# EasyEDA Pro project EtherCAT-RK3506.epro, board RK3506-V1
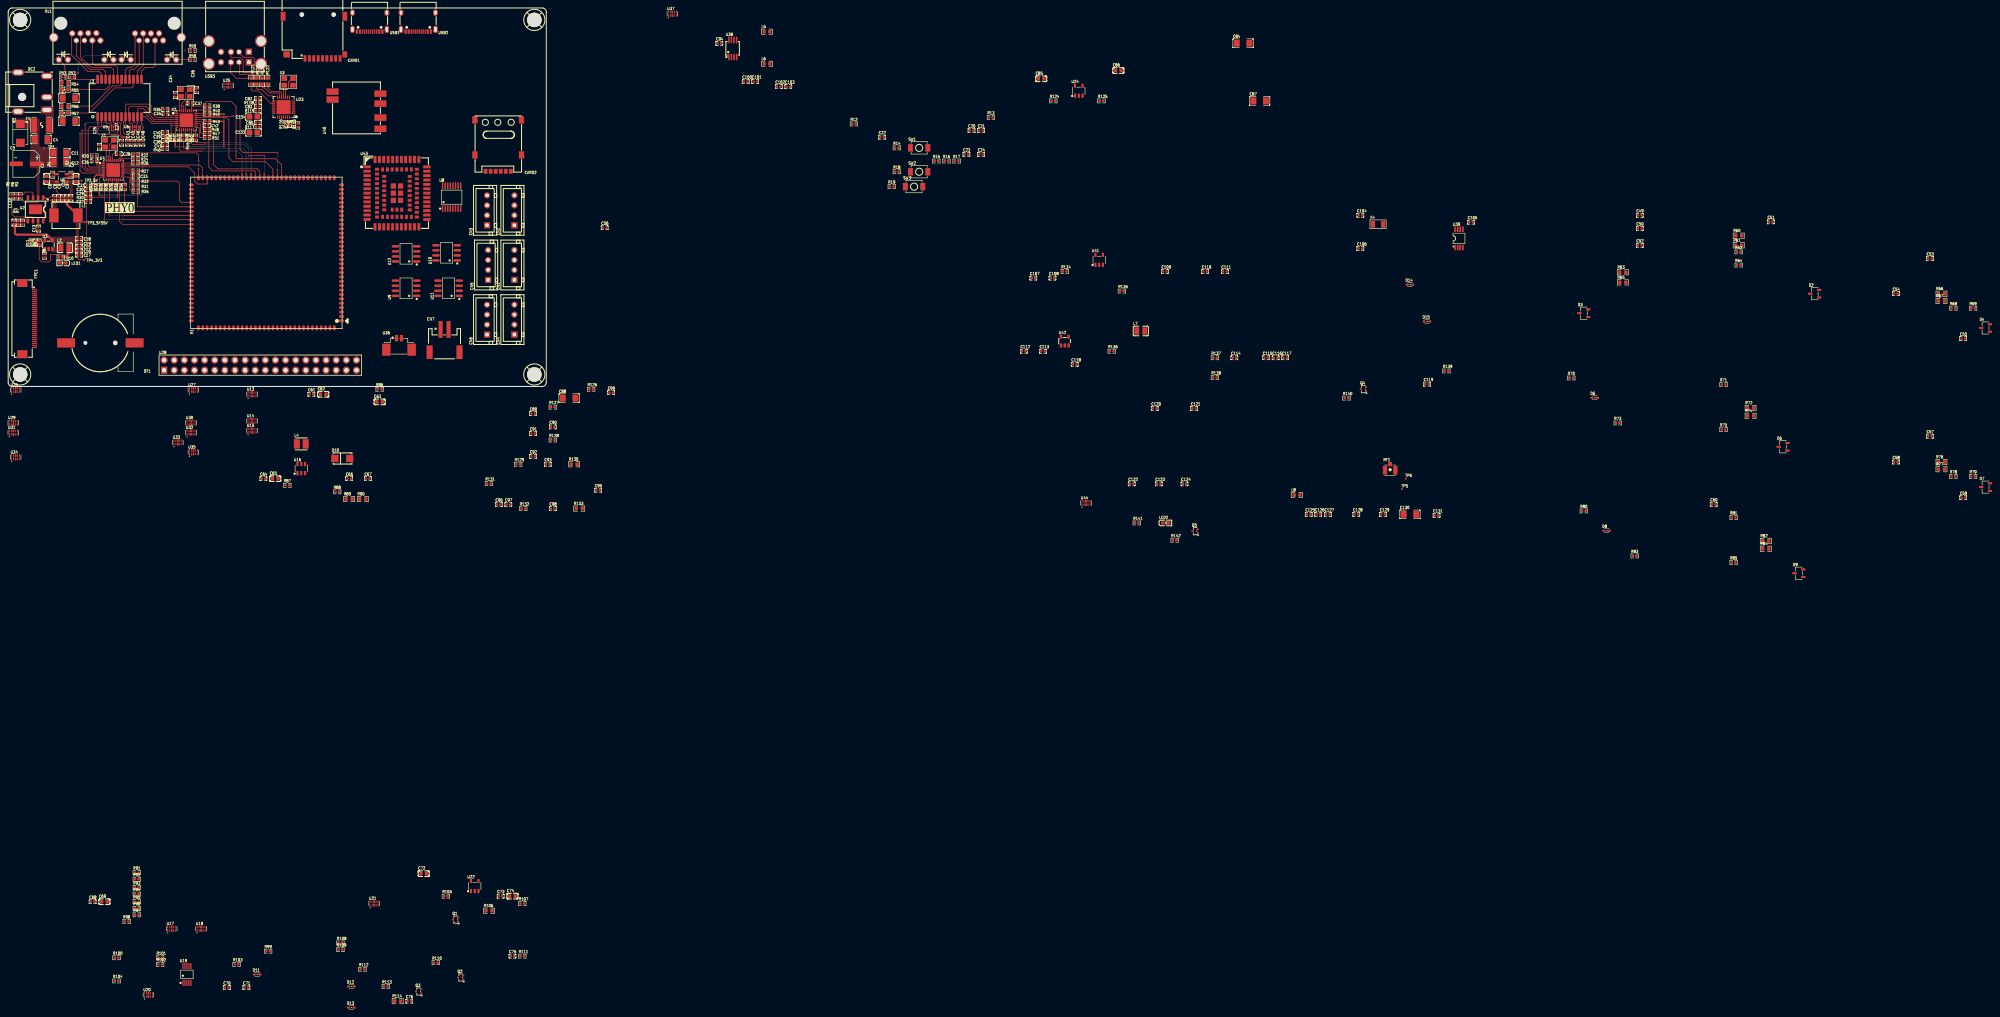
[diagram p12: board, top side]
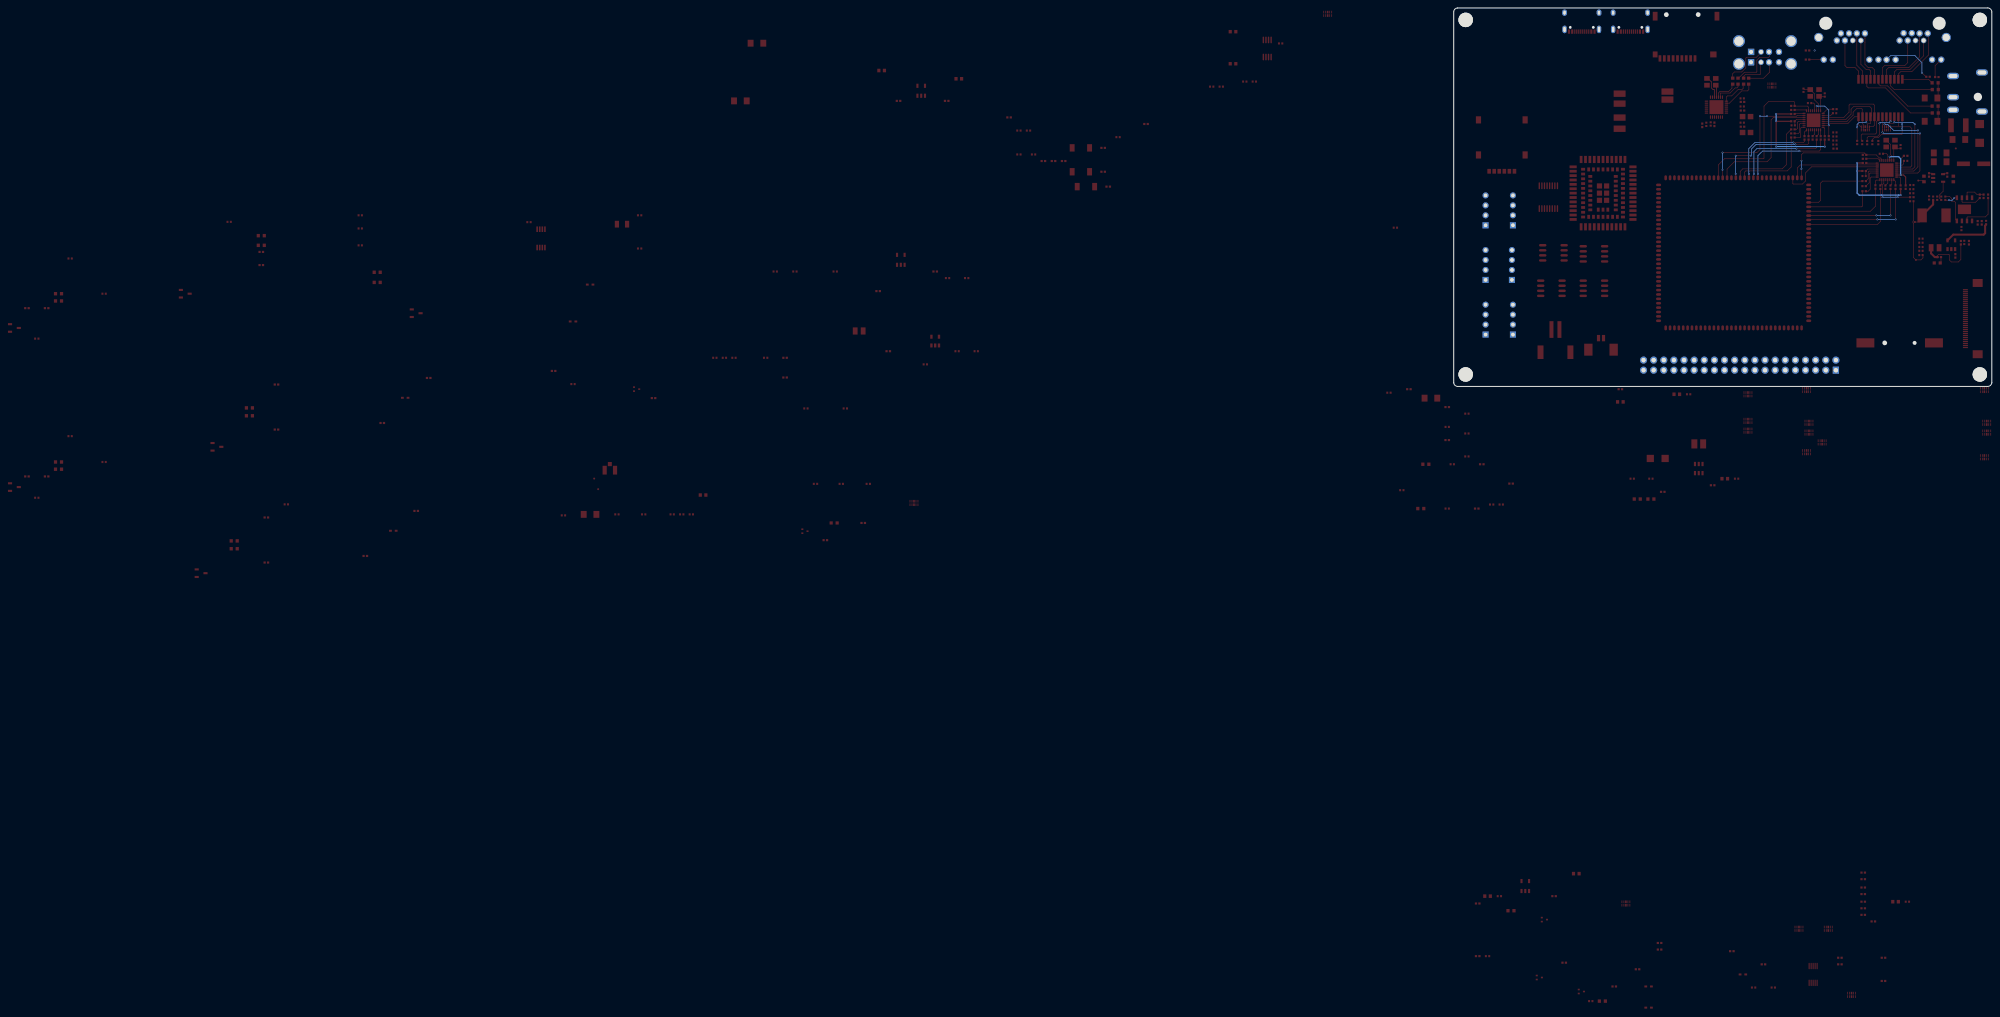
[diagram p13: board, bottom side, seen from below]

Outline 135 x 95 mm; copper layers: Top Layer, Bottom Layer. Coordinates in mm from the lower left corner of the outline.
Outline path: 0,94 0,1 arc(0.29,0.29) 1,0 134,0 arc(134.71,0.29) 135,1 135,94 arc(134.71,94.71) 134,95 1,95 arc(0.29,94.71) 0,94
Stack: Top Layer 0.035mm / Dielectric1 1.51mm FR4 er 4.5 / Bottom Layer 0.035mm

## Design rules (mm)
template: 自定义配置
spacing copperThickness1oz (default): track to track 0.102, other pairs 0.152 to 0.3
spacing copperThickness2oz: track to track 0.203, other pairs 0.152 to 0.3
track width copperThickness1oz (default): min 0.127, default 0.152, max 2.54
track width copperThickness2oz: min 0.203, default 0.254, max 2.54
differential pair differentialPair (default): width min 0.127, default 0.254, max 2.54; gap min 0.152, default 0.152
via viaSize (default): diameter min 0.45, default 0.45, max 10; hole min 0.3, default 0.3, max 6.3

## Placement (name value [footprint] x y rotation side)
BT1  CR1220-A1  [BAT-SMD_CR1220-2]  23.11 10.93 180 top
C1  10uF  [C0603]  9.65 52.07 270 top
C2  22uF  [C0603]  17.02 52.07 270 top
C3  100nF  [C0402]  15.74 47.31 90 top
C4  10uF  [C1206]  8.27 61.98 180 top
C5  100uF  [CAP-SMD_BD6.3-L6.6-W6.6-RD]  4.57 55.88 0 top
C6  100nF  [C0402]  11.67 47.24 90 top
C8  22uF  [C0402]  12.69 47.24 270 top
C9  22uF  [C0402]  13.7 47.24 270 top
C10  100nF  [C0402]  14.72 47.24 270 top
C11  10uF  [C1206]  12.95 58.62 180 top
C12  10uF  [C1206]  12.95 56.39 180 top
C13  1uF  [C0402]  7.62 39.63 90 top
C14  47pF  [C0402]  6.91 36.14 270 top
C15  22uF  [C0402]  17.78 35 180 top
C16  22uF  [C0402]  17.78 34.04 180 top
C17  100nF  [C0402]  17.78 32.97 180 top
C18  22uF  [C0402]  17.78 37.09 180 top
C19  22uF  [C0402]  17.78 36.07 180 top
C20  22uF  [C0402]  241.68 64.22 0 top
C21  22uF  [C0402]  244.08 64.22 0 top
C22  22uF  [C0402]  219.21 62.57 0 top
C23  22uF  [C0402]  240.41 58.23 0 top
C24  22uF  [C0402]  244.08 58.23 0 top
C25  18pF  [C0402]  22.89 60.18 270 top
C26  100nF  [C0402]  21.61 56.62 0 top
C27  18pF  [C0402]  28.47 61.19 270 top
C28  100nF  [C0402]  27.71 58.4 0 top
C29  100nF  [C0402]  20.09 48.49 180 top
C30  100nF  [C0402]  20.09 49.51 180 top
C31  10uF  [C0402]  20.07 50.55 0 top
C32  1uF  [C0402]  20.07 46.49 180 top
C33  100nF  [C0402]  32.03 52.81 0 top
C34  18pF  [C0402]  41.91 73.16 270 top
C35  100nF  [C0402]  39.44 68.58 0 top
C36  18pF  [C0402]  47.24 74.35 270 top
C37  100nF  [C0402]  45.72 71.12 0 top
C38  100nF  [C0402]  39.37 61.73 180 top
C39  100nF  [C0402]  39.37 62.74 180 top
C40  10uF  [C0402]  39.37 63.76 0 top
C41  1uF  [C0402]  39.37 60.71 180 top
C42  100nF  [C0402]  49.83 65.54 0 top
C43  100nF  [C0402]  29.97 61.22 90 top
C44  1nF  [C1206]  15.24 72.39 0 top
C45  100nF  [C0402]  31.27 61.18 90 top
C46  100nF  [C0402]  32.51 61.22 90 top
C47  1nF  [C1206]  15.24 66.55 0 top
C48  100nF  [C0402]  33.78 61.22 90 top
C49  100nF  [C0402]  409.33 42.96 0 top
C50  100nF  [C0402]  409.33 39.66 0 top
C51  100nF  [C0402]  442.22 41.31 0 top
C52  100nF  [C0402]  409.33 35.41 0 top
C53  1uF  [C0402]  482.12 32.11 0 top
C54  1uF  [C0402]  473.6 23.27 0 top
C55  100nF  [C0402]  490.49 11.99 0 top
C56  1uF  [C0402]  149.63 39.84 0 top
C57  1uF  [C0402]  482.12 -12.48 0 top
C58  1uF  [C0402]  473.6 -18.97 0 top
C59  100nF  [C0402]  490.49 -27.95 0 top
C60  1uF  [C0402]  427.88 -29.6 0 top
C61  100nF  [C0402]  76.06 -1.97 0 top
C62  10uF  [C0603]  79.03 -1.97 0 top
C63  10uF  [C0603]  93.19 -3.88 0 top
C64  1uF  [C0402]  64.03 -23.16 0 top
C65  10uF  [C0603]  67 -23.16 0 top
C66  1uF  [C0402]  85.53 -23.16 0 top
C67  1uF  [C0402]  90.22 -23.16 0 top
C68  100nF  [C0402]  21.18 -129.35 0 top
C69  10uF  [C0603]  24.14 -129.35 0 top
C70  4.7uF  [C0402]  54.82 -150.9 0 top
C71  100nF  [C0402]  59.76 -150.9 0 top
C72  22uF  [C0603]  104.24 -122.31 0 top
C73  100nF  [C0402]  123.54 -127.96 0 top
C74  22uF  [C0603]  126.51 -127.96 0 top
C75  100nF  [C0402]  126.51 -143.01 0 top
C76  1uF  [C0402]  100.62 -154.3 0 top
C77  100nF  [C0402]  70.52 65.88 90 top
C79  1uF  [C0402]  71.63 65.79 90 top
C80  100nF  [C0402]  62.62 66.21 0 top
C82  100nF  [C0402]  62.62 72.3 0 top
C83  1uF  [C0402]  62.62 70.27 0 top
C84  10uF  [C1206]  309.81 86.16 0 top
C85  22uF  [C0603]  259.17 77.22 0 top
C86  22uF  [C0603]  278.52 79.3 0 top
C87  10uF  [C1206]  313.97 71.67 0 top
C88  10uF  [C1206]  140.72 -2.95 0 top
C89  1uF  [C0402]  131.69 -6.84 0 top
C90  100pF  [C0402]  136.63 -10.17 0 top
C91  1uF  [C0402]  131.69 -11.82 0 top
C92  4.7nF  [C0402]  131.69 -17.58 0 top
C93  10nF  [C0402]  135.36 -19.54 0 top
C94  1uF  [C0402]  178.42 86.1 0 top
C95  100pF  [C0402]  148.02 -26.04 0 top
C96  22uF  [C0402]  123.08 -29.65 0 top
C97  100nF  [C0402]  125.48 -29.65 0 top
C98  10nF  [C0402]  136.63 -30.66 0 top
C99  4.7nF  [C0402]  151.25 -1.58 0 top
C100  22uF  [C0402]  185.02 76.52 0 top
C101  22uF  [C0402]  187.42 76.52 0 top
C102  680pF  [C0402]  193.32 75.25 0 top
C103  680pF  [C0402]  195.72 75.25 0 top
C104  18pF  [C0402]  339.24 42.96 0 top
C105  1uF  [C0402]  367 41.24 0 top
C106  18pF  [C0402]  339.24 34.62 0 top
C107  22uF  [C0402]  257.19 27.2 0 top
C108  100nF  [C0402]  261.99 27.2 0 top
C109  22uF  [C0402]  290.18 28.85 0 top
C110  100nF  [C0402]  300.28 28.85 0 top
C111  100nF  [C0402]  305.22 28.85 0 top
C112  22uF  [C0402]  254.79 8.84 0 top
C113  100nF  [C0402]  259.59 8.84 0 top
C114  47pF  [C0402]  307.62 7.19 0 top
C115  22uF  [C0402]  315.57 7.19 0 top
C116  22uF  [C0402]  317.97 7.19 0 top
C117  100nF  [C0402]  320.37 7.19 0 top
C118  100nF  [C0402]  267.56 5.54 0 top
C119  100nF  [C0402]  355.96 0.59 0 top
C120  100nF  [C0402]  287.64 -5.53 0 top
C121  100pF  [C0402]  297.52 -5.53 0 top
C122  33pF  [C0402]  281.87 -24.46 0 top
C123  33pF  [C0402]  288.65 -24.46 0 top
C124  33pF  [C0402]  295.12 -24.46 0 top
C125  22uF  [C0402]  326.27 -32.12 0 top
C126  22uF  [C0402]  328.67 -32.12 0 top
C127  22uF  [C0402]  331.07 -32.12 0 top
C128  4.7uF  [C0402]  338.22 -32.12 0 top
C129  100nF  [C0402]  344.94 -32.12 0 top
C130  10uF  [C1206]  351.68 -32.12 0 top
C131  33pF  [C0402]  358.36 -32.37 0 top
C132  1nF  [C0402]  1.44 41.14 270 top
C133  10uF  [C0805]  61.53 63.74 0 top
C134  10uF  [C0805]  61.53 67.73 0 top
CARD1  TF PUSH  [TF-SMD_TF-PUSH]  76.71 87.63 180 top
CARD2  SMN-305  [SIM-SMD_SMN-305]  122.94 60.46 180 top
CN1  LAIL-PHC2.54-4P-01-XH-L  [CONN-TH_LAIL-PHC2.54-4P-01-XH-L]  127 30.48 90 top
CN2  LAIL-PHC2.54-4P-01-XH-L  [CONN-TH_LAIL-PHC2.54-4P-01-XH-L]  127 44.2 90 top
CN3  LAIL-PHC2.54-4P-01-XH-L  [CONN-TH_LAIL-PHC2.54-4P-01-XH-L]  120.14 44.2 90 top
CN4  LAIL-PHC2.54-4P-01-XH-L  [CONN-TH_LAIL-PHC2.54-4P-01-XH-L]  127 16.77 90 top
CN5  LAIL-PHC2.54-4P-01-XH-L  [CONN-TH_LAIL-PHC2.54-4P-01-XH-L]  120.4 30.48 90 top
CN6  LAIL-PHC2.54-4P-01-XH-L  [CONN-TH_LAIL-PHC2.54-4P-01-XH-L]  120.14 16.77 90 top
CN7  HX-PH2.0-2AWB  [CONN-SMD_2P-P2.00_HX-PH2.0-2AWB]  109.47 11.43 0 top
D1  SMBJ33A  [SMB_L4.6-W3.6-LS5.3-RD]  3.05 63.5 270 top
D2  BST23C152V  [SOT-23-3_L3.0-W1.7-P0.95-LS2.9-BR]  453.23 23.27 0 top
D3  BST23C152V  [SOT-23-3_L3.0-W1.7-P0.95-LS2.9-BR]  395.3 18.38 0 top
D4  BST23C152V  [SOT-23-3_L3.0-W1.7-P0.95-LS2.9-BR]  496.1 14.67 0 top
D5  LRB520S-30T1G  [SOD-523_L1.2-W0.8-LS1.6-RD-2]  398.06 -2.86 0 top
D6  BST23C152V  [SOT-23-3_L3.0-W1.7-P0.95-LS2.9-BR]  445.29 -15.16 0 top
D7  BST23C152V  [SOT-23-3_L3.0-W1.7-P0.95-LS2.9-BR]  496.1 -25.27 0 top
D8  LRB520S-30T1G  [SOD-523_L1.2-W0.8-LS1.6-RD-2]  401.04 -36.23 0 top
D9  BST23C152V  [SOT-23-3_L3.0-W1.7-P0.95-LS2.9-BR]  449.26 -46.89 0 top
D10  SM340AF  [SMA-FL_L3.5-W2.5-LS4.6-L-RD]  83.82 -18.08 0 top
D11  LRB520S-30T1G  [SOD-523_L1.2-W0.8-LS1.6-RD-2]  62.45 -147.61 0 top
D12  LRB520S-30T1G  [SOD-523_L1.2-W0.8-LS1.6-RD-2]  86.11 -150.63 0 top
D13  LRB520S-30T1G  [SOD-523_L1.2-W0.8-LS1.6-RD-2]  86.11 -155.94 0 top
D14  LRB520S-30T1G  [SOD-523_L1.2-W0.8-LS1.6-RD-2]  351.66 25.56 0 top
D15  LRB520S-30T1G  [SOD-523_L1.2-W0.8-LS1.6-RD-2]  355.96 16.31 0 top
DC2  DC-044A-A200  [DC-IN-TH_DC-044A-20A]  6.1 73.92 0 top
F1  SMD1812-110-33  [F1812]  8.38 65.54 180 top
FPC1  FPC-05F-30PH20  [FPC-SMD_30P-P0.50_XUNPU_FPC-05F-30PH20]  5.08 17.02 270 top
L1  15uH  [IND-SMD_L7.3-W6.8]  14.48 42.93 0 top
L2  1uH  [L0806]  14.22 34.8 0 top
L3  350uH  [SMD-24_L15.1-W7.1-P1.00-LS10.0-BL]  27.94 72.39 0 top
L4  4.7uH  [IND-SMD_L2.5-W2.5]  73.52 -14.43 0 top
L5  UPZ1608E101-3R0TF  [L0603]  190.37 89.05 0 top
L6  UPZ1608E101-3R0TF  [L0603]  190.37 80.99 0 top
L7  1uH  [L0806]  284.16 13.92 0 top
L8  UPZ1608E101-3R0TF  [L0603]  323.32 -27.26 0 top
LED1  KT-0603R  [LED-SMD_L1.6-W0.8-R-RD]  13.69 30.99 180 top
LED2  KT-0603R  [LED-SMD_L1.6-W0.8-R-RD]  290.43 -34.28 0 top
M1  SOM3506  [SOM3506_128P]  64.77 33.53 90 top
Q1  MMFTN3019E  [SOT-523-3_L1.6-W0.8-P1.00-LS1.6-BR]  112.25 -133.84 0 top
Q2  MMFTN3019E  [SOT-523-3_L1.6-W0.8-P1.00-LS1.6-BR]  113.52 -148.38 0 top
Q3  MMFTN3019E  [SOT-523-3_L1.6-W0.8-P1.00-LS1.6-BR]  102.97 -151.9 0 top
Q4  MMFTN3019E  [SOT-523-3_L1.6-W0.8-P1.00-LS1.6-BR]  340 -0.68 0 top
Q5  MMFTN3019E  [SOT-523-3_L1.6-W0.8-P1.00-LS1.6-BR]  297.77 -36.35 0 top
R1  10kΩ  [R0402]  11.18 53.09 270 top
R2  3.3kΩ  [R0402]  15.75 53.09 90 top
R3  100kΩ  [R0402]  3.02 47.72 270 top
R4  105kΩ  [R0402]  2.53 41.07 270 top
R5  0Ω  [R0402]  0.93 47.72 270 top
R6  47kΩ  [R0402]  2.06 47.72 90 top
R7  20kΩ  [R0402]  3.54 41.07 90 top
R8  10kΩ  [R0402]  9.14 32.77 90 top
R9  45.3kΩ  [R0402]  7.76 36.07 270 top
R10  1kΩ  [R0402]  13.18 32.46 0 top
R11  10kΩ  [R0402]  5.73 36.07 90 top
R12  0Ω  [R0402]  212.19 65.88 0 top
R13  0Ω  [R0402]  246.55 67.53 0 top
R14  100Ω  [R0402]  222.95 59.88 0 top
R15  2.2kΩ  [R0402]  232.86 56.58 0 top
R16  2.2kΩ  [R0402]  235.4 56.58 0 top
R17  10kΩ  [R0402]  237.94 56.58 0 top
R18  100Ω  [R0402]  222.95 53.89 0 top
R19  100Ω  [R0402]  221.68 50.15 0 top
R20  2.49kΩ  [R0402]  21.61 57.89 0 top
R21  0Ω  [R0402]  21.61 50.02 270 top
R22  4.7kΩ  [R0402]  31.93 58.12 0 top
R23  4.7kΩ  [R0402]  22.89 50.02 90 top
R24  4.7kΩ  [R0402]  31.92 57.14 0 top
R25  22Ω  [R0402]  24.16 50.02 270 top
R26  4.7kΩ  [R0402]  31.93 56.09 0 top
R27  100kΩ  [R0402]  32.03 54.08 0 top
R28  22Ω  [R0402]  25.42 50.02 270 top
R29  4.7kΩ  [R0402]  26.69 50.02 90 top
R30  0Ω  [R0402]  20.07 47.5 180 top
R31  4.7kΩ  [R0402]  32.03 50.27 0 top
R32  22Ω  [R0402]  32.03 51.54 0 top
R33  22Ω  [R0402]  27.97 50.02 270 top
R34  22Ω  [R0402]  29.2 50.06 270 top
R35  22Ω  [R0402]  32.03 49 0 top
R36  2.49kΩ  [R0402]  39.37 69.6 0 top
R37  0Ω  [R0402]  40.89 62.39 270 top
R38  4.7kΩ  [R0402]  49.9 70.42 0 top
R39  4.7kΩ  [R0402]  41.91 62.39 90 top
R40  4.7kΩ  [R0402]  49.9 69.4 0 top
R41  22Ω  [R0402]  42.92 62.39 270 top
R42  4.7kΩ  [R0402]  49.9 68.39 0 top
R43  100kΩ  [R0402]  49.9 66.55 0 top
R44  22Ω  [R0402]  43.94 62.39 270 top
R45  4.7kΩ  [R0402]  44.96 62.39 90 top
R46  0Ω  [R0402]  39.3 59.69 180 top
R47  4.7kΩ  [R0402]  49.9 63.5 0 top
R48  22Ω  [R0402]  49.9 64.52 0 top
R49  22Ω  [R0402]  45.97 62.39 270 top
R50  22Ω  [R0402]  46.99 62.39 270 top
R51  22Ω  [R0402]  49.9 62.49 0 top
R52  1kΩ  [R0402]  16 77.73 0 top
R53  1kΩ  [R0402]  13.79 77.65 0 top
R54  75Ω  [R0603]  14.22 76.2 180 top
R55  75Ω  [R0603]  14.19 74.51 180 top
R56  75Ω  [R0603]  14.22 70.36 180 top
R57  75Ω  [R0603]  14.19 68.64 180 top
R58  1kΩ  [R0402]  46.23 82.05 180 top
R59  1kΩ  [R0402]  46.23 84.33 0 top
R60  5.1Ω  [R0603]  434.16 37.84 0 top
R61  5.1Ω  [R0603]  434.16 35.41 0 top
R62  22Ω  [R0402]  434.16 33.76 0 top
R63  5.1Ω  [R0603]  405.08 28.65 0 top
R64  22Ω  [R0402]  434.16 30.46 0 top
R65  5.1Ω  [R0603]  405.08 26.11 0 top
R66  5.1Ω  [R0603]  485.03 23.27 0 top
R67  5.1Ω  [R0603]  485.03 21.46 0 top
R68  60.4Ω  [R0402]  488.01 19.65 0 top
R69  60.4Ω  [R0402]  492.96 19.65 0 top
R70  4.7kΩ  [R0402]  392.16 2.12 0 top
R71  1.5kΩ  [R0402]  430.35 0.47 0 top
R72  5.1Ω  [R0603]  437.14 -5.4 0 top
R73  22Ω  [R0402]  403.81 -9.18 0 top
R74  5.1Ω  [R0603]  437.14 -7.37 0 top
R75  1.5kΩ  [R0402]  430.35 -10.83 0 top
R76  5.1Ω  [R0603]  485.03 -18.97 0 top
R77  5.1Ω  [R0603]  485.03 -20.78 0 top
R78  60.4Ω  [R0402]  488.01 -22.59 0 top
R79  60.4Ω  [R0402]  492.96 -22.59 0 top
R80  4.7kΩ  [R0402]  395.3 -31.25 0 top
R81  1.5kΩ  [R0402]  432.89 -32.9 0 top
R82  5.1Ω  [R0603]  440.95 -38.77 0 top
R83  22Ω  [R0402]  408.06 -42.56 0 top
R84  5.1Ω  [R0603]  440.95 -40.75 0 top
R85  1.5kΩ  [R0402]  432.89 -44.21 0 top
R86  10kΩ  [R0402]  93.19 -0.7 0 top
R87  10kΩ  [R0402]  70.03 -24.81 0 top
R88  100kΩ  [R0402]  82.55 -26.46 0 top
R89  10Ω  [R0603]  85.53 -28.28 0 top
R90  10Ω  [R0603]  88.95 -28.28 0 top
R91  22Ω  [R0402]  32.26 -122.04 0 top
R92  22Ω  [R0402]  32.26 -123.69 0 top
R93  22Ω  [R0402]  32.26 -125.79 0 top
R94  22Ω  [R0402]  32.26 -127.44 0 top
R95  22Ω  [R0402]  32.26 -129.35 0 top
R96  22Ω  [R0402]  32.26 -131 0 top
R97  22Ω  [R0402]  32.26 -132.65 0 top
R98  4.7kΩ  [R0402]  29.72 -134.3 0 top
R99  4.7kΩ  [R0402]  65.22 -141.77 0 top
R100  5.1kΩ  [R0402]  27.18 -143.42 0 top
R101  22Ω  [R0402]  38.11 -143.42 0 top
R102  22Ω  [R0402]  38.11 -145.07 0 top
R103  100Ω  [R0402]  57.29 -145.07 0 top
R104  5.1kΩ  [R0402]  27.18 -149.24 0 top
R105  100kΩ  [R0402]  109.82 -127.96 0 top
R106  6.8kΩ  [R0603]  120.63 -131.61 0 top
R107  10kΩ  [R0402]  128.98 -129.8 0 top
R108  22Ω  [R0402]  83.35 -139.71 0 top
R109  22Ω  [R0402]  83.35 -141.36 0 top
R110  100kΩ  [R0402]  107.28 -144.66 0 top
R111  15kΩ  [R0402]  128.98 -143.01 0 top
R112  15kΩ  [R0402]  88.88 -146.31 0 top
R113  33kΩ  [R0402]  94.72 -150.63 0 top
R114  220kΩ  [R0603]  97.71 -154.3 0 top
R115  0Ω  [R0402]  72.64 65.54 270 top
R116  10kΩ  [R0402]  69.6 65.79 90 top
R117  100kΩ  [R0402]  62.55 65.19 180 top
R118  10kΩ  [R0402]  62.55 71.42 0 top
R119  0Ω  [R0402]  62.55 69.26 0 top
R120  2.2Ω  [R0603]  62.27 76.63 90 top
R121  2.2Ω  [R0603]  61 76.63 90 top
R122  2.2Ω  [R0603]  65 76.63 90 top
R123  2.2Ω  [R0603]  63.68 76.63 90 top
R124  100kΩ  [R0402]  262.2 71.67 0 top
R125  3.3kΩ  [R0402]  274.29 71.67 0 top
R126  2.2kΩ  [R0402]  146.24 -0.7 0 top
R127  1.1kΩ  [R0402]  136.63 -5.19 0 top
R128  1.1kΩ  [R0402]  136.63 -13.47 0 top
R129  1kΩ  [R0402]  127.95 -19.54 0 top
R130  75kΩ  [R0603]  141.99 -19.54 0 top
R131  0Ω  [R0402]  120.61 -24.39 0 top
R132  1kΩ  [R0402]  129.22 -30.66 0 top
R133  75kΩ  [R0603]  143.26 -30.66 0 top
R134  10kΩ  [R0402]  265.09 28.85 0 top
R135  3.3kΩ  [R0402]  279.4 23.93 0 top
R136  10kΩ  [R0402]  276.86 8.84 0 top
R137  53.6kΩ  [R0402]  302.75 7.19 0 top
R138  10kΩ  [R0402]  302.75 2.24 0 top
R139  4.7kΩ  [R0402]  360.83 3.89 0 top
R140  10kΩ  [R0402]  335.75 -2.93 0 top
R141  1kΩ  [R0402]  283.14 -34.28 0 top
R142  10kΩ  [R0402]  292.65 -38.59 0 top
RF1  6GHz  [IPEX-SMD_3P-L2.6-W2.6-LS3.0_RF1200001R]  346.71 -20.26 0 top
RJ1  DS1129-04-S8B0P-X  [RJ45-TH_DS1129-04]  27.43 85.35 180 top
SCREW1  -  [M3螺丝]  3 92 0 top
SCREW2  -  [M3螺丝]  132 92 0 top
SCREW3  -  [M3螺丝]  132 3 0 top
SCREW4  -  [M3螺丝]  3 3 0 top
SW1  TS-1088-AR02016  [SW-SMD_L3.9-W3.0-P4.45]  228.54 59.88 0 top
SW2  TS-1088-AR02016  [SW-SMD_L3.9-W3.0-P4.45]  228.54 53.89 0 top
SW3  TS-1088-AR02016  [SW-SMD_L3.9-W3.0-P4.45]  227.27 50.15 0 top
TP1  -  [Test-Point-0.5mm]  9.03 59.74 0 top
TP2_5V  -  [Test-Point-0.5mm]  18.45 51.68 0 top
TP3_SYS5V  -  [Test-Point-0.5mm]  19.3 41.27 0 top
TP4_3V3  -  [Test-Point-0.5mm]  19.05 31.75 0 top
TP5  -  [Test-Point-0.5mm]  349.65 -25.79 0 top
TP6  -  [Test-Point-0.5mm]  350.65 -23.14 0 top
U1  ETA6280S2F  [SOT-23-5_L3.0-W1.5-P0.95-LS2.8-BL]  13.46 52.33 90 top
U2  ETA2808E8A  [ESOP-8_L4.9-W3.9-P1.27-LS6.0-BL-EP]  6.86 44.45 180 top
U3  ETA3417S2F  [SOT-23-5_L2.9-W1.6-P0.95-LS2.8-BL]  10.16 35.56 0 top
U4  YT8512C  [QFN-32_L5.0-W5.0-P0.50-BL-EP3.4]  26.34 54.31 270 top
U5  LM-SE05NRE14GA  [DFN2510-10_L2.5-W1.0-P0.50-BL]  26.42 64.77 0 top
U6  LM-SE05NRE14GA  [DFN2510-10_L2.5-W1.0-P0.50-BL]  31.75 64.77 0 top
U7  YT8512C  [QFN-32_L5.0-W5.0-P0.50-BL-EP3.4]  44.7 66.81 270 top
U8  BL13232ETS  [TSSOP-16_L5.0-W4.4-P0.65-LS6.4-BL]  111.25 47.5 0 top
U9  SIT1051AT/3  [SOP-8_L4.9-W3.9-P1.27-LS6.0-BL]  99.82 24.64 90 top
U10  HD588E  [SOP-8_L4.9-W3.9-P1.27-LS6.0-BL]  109.98 33.53 90 top
U11  SIT1051AT/3  [SOP-8_L4.9-W3.9-P1.27-LS6.0-BL]  110.49 24.64 90 top
U12  HD588E  [SOP-8_L4.9-W3.9-P1.27-LS6.0-BL]  99.82 33.28 90 top
U13  LM-SE05NRE14GA  [DFN2510-10_L2.5-W1.0-P0.50-BL]  61.18 -1.97 0 top
U14  LM-SE05NRE14GA  [DFN2510-10_L2.5-W1.0-P0.50-BL]  61.18 -8.65 0 top
U15  LM-SE05NRE14GA  [DFN2510-10_L2.5-W1.0-P0.50-BL]  61.18 -11.11 0 top
U16  STI9287C  [SOT-23-6_L2.9-W1.6-P0.95-LS2.8-BL]  73.52 -20.62 0 top
U17  LM-SE05NRE14GA  [DFN2510-10_L2.5-W1.0-P0.50-BL]  41.03 -136.14 0 top
U18  LM-SE05NRE14GA  [DFN2510-10_L2.5-W1.0-P0.50-BL]  48.38 -136.14 0 top
U19  CH340E  [MSOP-10_L3.0-W3.0-P0.50-LS5.0-BL]  44.83 -147.61 0 top
U20  LM-SE05NRE14GA  [DFN2510-10_L2.5-W1.0-P0.50-BL]  35.19 -152.74 0 top
U21  LM-SE05NRE14GA  [DFN2510-10_L2.5-W1.0-P0.50-BL]  91.8 -129.8 0 top
U22  ETA6280S2F  [SOT-23-5_L3.0-W1.5-P0.95-LS2.8-BL]  117.04 -125.42 0 top
U23  CH334H  [QFN-28_L5.0-W5.0-P0.50-BL-EP]  69.09 70.11 90 top
U24  ETA6280S2F  [SOT-23-5_L3.0-W1.5-P0.95-LS2.8-BL]  268.6 74.21 0 top
U25  LM-SE05NRE14GA  [DFN2510-10_L2.5-W1.0-P0.50-BL]  55.17 75.52 0 top
U26  LM-SE05NRE14GA  [DFN2510-10_L2.5-W1.0-P0.50-BL]  1.87 -0.9 0 top
U27  LM-SE05NRE14GA  [DFN2510-10_L2.5-W1.0-P0.50-BL]  46.47 -0.9 0 top
U28  PZ2.54-2*20  [HDR-TH_40P-P2.54-V-M-R2-C20-S2.54]  63.25 5.34 0 top
U29  LM-SE05NRE14GA  [DFN2510-10_L2.5-W1.0-P0.50-BL]  1.28 -9.14 0 top
U30  LM-SE05NRE14GA  [DFN2510-10_L2.5-W1.0-P0.50-BL]  45.87 -9.14 0 top
U31  LM-SE05NRE14GA  [DFN2510-10_L2.5-W1.0-P0.50-BL]  1.28 -11.59 0 top
U32  LM-SE05NRE14GA  [DFN2510-10_L2.5-W1.0-P0.50-BL]  45.87 -11.59 0 top
U33  LM-SE05NRE14GA  [DFN2510-10_L2.5-W1.0-P0.50-BL]  42.57 -14.05 0 top
U34  LM-SE05NRE14GA  [DFN2510-10_L2.5-W1.0-P0.50-BL]  1.87 -17.78 0 top
U35  LM-SE05NRE14GA  [DFN2510-10_L2.5-W1.0-P0.50-BL]  46.47 -16.51 0 top
U36  ZX-MX1.25-2PLT  [CONN-SMD_2P-P1.25-MX1.25-2P-LT]  98.04 10.67 0 top
U37  LM-SE05NRE14GA  [DFN2510-10_L2.5-W1.0-P0.50-BL]  166.62 93.53 0 top
U38  NS4150B  [MSOP-8_L3.0-W3.0-P0.65-LS5.0-BL]  181.78 84.83 0 top
U39  HT8563ARMZ  [MSOP-8_L3.0-W3.0-P0.65-LS4.9-BL]  363.98 37.16 0 top
U40  2.4GHz  [WIRELM-SMD_M573H-USBDG-NN]  87.38 69.35 90 top
U41  ETA6280S2F  [SOT-23-5_L3.0-W1.5-P0.95-LS2.8-BL]  273.72 31.77 0 top
U42  ETA3417S2F  [SOT-23-5_L2.9-W1.6-P0.95-LS2.8-BL]  265.09 11.38 0 top
U43  ML307R-DL  [LCC-LGA-109_L17.7-W15.8-P1.10_MC661]  97.54 48.52 0 top
U44  LM-SE05NRE14GA  [DFN2510-10_L2.5-W1.0-P0.50-BL]  270.41 -29.26 0 top
USB1  TYPE-C 16PIN 2MD(073)  [USB-C-SMD_TYPE-C-16PIN-2MD-073]  90.68 91.44 180 top
USB2  TYPE-C 16PIN 2MD(073)  [USB-C-SMD_TYPE-C-16PIN-2MD-073]  102.87 91.44 180 top
USB3  AF SS-JB17.6  [USB-A-TH_AF-SS-JB17.6]  56.9 83.82 180 top
X1  25MHz  [CRYSTAL-SMD_4P-L3.2-W2.5-BL]  25.4 60.96 180 top
X2  25MHz  [CRYSTAL-SMD_4P-L3.2-W2.5-BL]  44.45 73.66 180 top
X3  12MHz  [CRYSTAL-SMD_4P-L3.2-W2.5-BL]  70.36 76.46 0 top
X4  32.768kHz  [CRYSTAL-SMD_L3.2-W1.5-1]  343.67 40.73 0 top

## Footprints (pads in the part's own frame, mm; a bottom-side part is the same pattern mirrored in y, then rotated)
BAT-SMD_CR1220-2
  rect 4.5x2.3 smd: 1(-8.6,0) 2(8.6,0)
C0402
  rect 0.5x0.54 smd: 1(-0.42,0) 2(0.42,0)
C0603
  rect 0.8x0.9 smd: 1(-0.7,0) 2(0.7,0)
C0805
  rect 1.41x1.35 smd: 1(-1,0) 2(1,0)
C1206
  rect 1.485x1.728 smd: 1(-1.593,0) 2(1.593,0)
CAP-SMD_BD6.3-L6.6-W6.6-RD
  rect 3.26x1.15 smd: 1(2.555,0) 2(-2.555,0)
CONN-SMD_2P-P1.25-MX1.25-2P-LT
  rect 0.8x1.6 smd: 1(-0.625,1.45) 2(0.625,1.45)
  rect 2.1x3 smd: 3(-3.175,-1.45) 4(3.175,-1.45)
CONN-SMD_2P-P2.00_HX-PH2.0-2AWB
  rect 1x4.2 smd: 1(-1,2.85) 2(1,2.85)
  rect 1.5x3.4 smd: 3(3.75,-2.85) 4(-3.75,-2.85)
CONN-TH_LAIL-PHC2.54-4P-01-XH-L
  rect 1.524x1.524 hole 0.914: 1(-3.75,0)
  round 1.524 hole 0.914: 2(-1.25,0) 3(1.25,0) 4(3.75,0)
CRYSTAL-SMD_4P-L3.2-W2.5-BL
  rect 1.4x1.2 smd: 1(-1.1,-0.85) 2(1.1,-0.85) 3(1.1,0.85) 4(-1.1,0.85)
CRYSTAL-SMD_L3.2-W1.5-1
  rect 1.05x1.7 smd: 1(-1.275,0) 2(1.275,0)
DC-IN-TH_DC-044A-20A
  oval 3x1.6 hole 2.2x1: 1(3.625,-4.5) 2(3.625,4.001) 3(3.625,-1.3) 4(-3.625,-4.9) 5(-3.625,4.9)
DFN2510-10_L2.5-W1.0-P0.50-BL
  rect 0.2x0.665 smd: 1(-1,-0.433) 2(-0.5,-0.433) 4(0.5,-0.433) 5(1,-0.433) 6(1,0.433) 7(0.5,0.433) 9(-0.5,0.433) 10(-1,0.433)
  rect 0.4x0.665 smd: 3(0,-0.433) 8(0,0.433)
ESOP-8_L4.9-W3.9-P1.27-LS6.0-BL-EP
  rect 0.6x1.2 smd: 1(-1.905,-2.909) 2(-0.635,-2.909) 3(0.635,-2.909) 4(1.905,-2.909) 5(1.905,2.909) 6(0.635,2.909) 7(-0.635,2.909) 8(-1.905,2.909)
  rect 3.3x2.4 smd: 9(0,0)
F1812
  rect 1.407x3.499 smd: 1(-1.853,0) 2(1.853,0)
FPC-SMD_30P-P0.50_XUNPU_FPC-05F-30PH20
  rect 0.3x1.25 smd: 1(-7.25,1.538) 2(-6.75,1.538) 3(-6.25,1.538) 4(-5.75,1.538) 5(-5.25,1.538) 6(-4.75,1.538) 7(-4.25,1.538) 8(-3.75,1.538) 9(-3.25,1.538) 10(-2.75,1.538) 11(-2.25,1.538) 12(-1.75,1.538) 13(-1.25,1.538) 14(-0.75,1.538) 15(-0.25,1.538) 16(0.25,1.538) 17(0.75,1.538) 18(1.25,1.538) 19(1.75,1.538) 20(2.25,1.538) 21(2.75,1.538) 22(3.25,1.538) 23(3.75,1.538) 24(4.25,1.538) 25(4.75,1.538) 26(5.25,1.538) 27(5.75,1.538) 28(6.25,1.538) 29(6.75,1.538) 30(7.25,1.538)
  rect 2x2.5 smd: 31(8.94,-1.538) 32(-8.94,-1.538)
HDR-TH_40P-P2.54-V-M-R2-C20-S2.54
  rect 1.575x1.8 hole 1.1: 1(-24.13,-1.27)
  round 1.8 hole 1.1: 2(-24.13,1.27) 3(-21.59,-1.27) 4(-21.59,1.27) 5(-19.05,-1.27) 6(-19.05,1.27) 7(-16.51,-1.27) 8(-16.51,1.27) 9(-13.97,-1.27) 10(-13.97,1.27) 11(-11.43,-1.27) 12(-11.43,1.27) 13(-8.89,-1.27) 14(-8.89,1.27) 15(-6.35,-1.27) 16(-6.35,1.27) 17(-3.81,-1.27) 18(-3.81,1.27) 19(-1.27,-1.27) 20(-1.27,1.27) 21(1.27,-1.27) 22(1.27,1.27) 23(3.81,-1.27) 24(3.81,1.27) 25(6.35,-1.27) 26(6.35,1.27) 27(8.89,-1.27) 28(8.89,1.27) 29(11.43,-1.27) 30(11.43,1.27) 31(13.97,-1.27) 32(13.97,1.27) 33(16.51,-1.27) 34(16.51,1.27) 35(19.05,-1.27) 36(19.05,1.27) 37(21.59,-1.27) 38(21.59,1.27) 39(24.13,-1.27) 40(24.13,1.27)
IND-SMD_L2.5-W2.5
  rect 1.5x2.3 smd: 1(-1.1,0) 2(1.1,0)
IND-SMD_L7.3-W6.8
  rect 2.35x3.5 smd: 1(-3,0) 2(3,0)
IPEX-SMD_3P-L2.6-W2.6-LS3.0_RF1200001R
  rect 1x1.05 smd: 1(0,0.762)
  rect 1.05x2.2 smd: 2(-1.3,-0.762) 3(1.3,-0.762)
L0603
  rect 0.8x0.864 smd: 1(-0.7,0) 2(0.7,0)
L0806
  rect 1.2x1.8 smd: 1(-1,0) 2(1,0)
LCC-LGA-109_L17.7-W15.8-P1.10_MC661
  rect 1.8x0.7 smd: 1(-7.5,6.6) 2(-7.5,5.5) 3(-7.5,4.4) 4(-7.5,3.3) 5(-7.5,2.2) 6(-7.5,1.1) 7(-7.5,0) 8(-7.5,-1.1) 9(-7.5,-2.2) 10(-7.5,-3.3) 11(-7.5,-4.4) 12(-7.5,-5.5) 13(-7.5,-6.6) 23(7.5,-6.6) 24(7.5,-5.5) 25(7.5,-4.4) 26(7.5,-3.3) 27(7.5,-2.2) 28(7.5,-1.1) 29(7.5,0) 30(7.5,1.1) 31(7.5,2.2) 32(7.5,3.3) 33(7.5,4.4) 34(7.5,5.5) 35(7.5,6.6)
  rect 0.7x1.8 smd: 14(-4.4,-8.45) 15(-3.3,-8.45) 16(-2.2,-8.45) 17(-1.1,-8.45) 18(0,-8.45) 19(1.1,-8.45) 20(2.2,-8.45) 21(3.3,-8.45) 22(4.4,-8.45) 36(4.4,8.45) 37(3.3,8.45) 38(2.2,8.45) 39(1.1,8.45) 40(0,8.45) 41(-1.1,8.45) 42(-2.2,8.45) 43(-3.3,8.45) 44(-4.4,8.45) 95(-5.5,-8.45) 96(5.5,-8.45) 97(5.5,8.45) 98(-5.5,8.45)
  rect 1x0.7 smd: 45(-5,4.8) 46(-5,3.6) 47(-5,2.4) 48(-5,1.2) 49(-5,0) 50(-5,-1.2) 51(-5,-2.4) 52(-5,-3.6) 53(-5,-4.8) 59(5,-4.8) 60(5,-3.6) 61(5,-2.4) 62(5,-1.2) 63(5,0) 64(5,1.2) 65(5,2.4) 66(5,3.6) 67(5,4.8) 73(-3.2,4.2) 74(-3.2,3) 75(-3.2,1.8) 76(-3.2,0.6) 77(-3.2,-0.6) 78(-3.2,-1.8) 79(-3.2,-3) 80(-3.2,-4.2) 81(3.2,-4.2) 82(3.2,-3) 83(3.2,-1.8) 84(3.2,-0.6) 85(3.2,0.6) 86(3.2,1.8) 87(3.2,3) 88(3.2,4.2) 99(-5,6) 100(-5,-6) 103(5,-6) 104(5,6)
  rect 0.7x1 smd: 54(-2.4,-5.95) 55(-1.2,-5.95) 56(0,-5.95) 57(1.2,-5.95) 58(2.4,-5.95) 68(2.4,5.95) 69(1.2,5.95) 70(0,5.95) 71(-1.2,5.95) 72(-2.4,5.95) 101(-3.6,-5.95) 102(3.6,-5.95) 105(3.6,5.95) 106(-3.6,5.95) 107(-1.2,-4.15) 108(0,-4.15) 109(1.2,-4.15)
  rect 1.3x1.3 smd: 89(-0.9,1.8) 90(-0.9,0) 91(-0.9,-1.8) 92(0.9,-1.8) 93(0.9,0) 94(0.9,1.8)
LED-SMD_L1.6-W0.8-R-RD
  rect 0.8x0.8 smd: 1(0.75,0) 2(-0.75,0)
M3螺丝
  round 3.6 hole 3.6: 1(0,0)
MSOP-8_L3.0-W3.0-P0.65-LS4.9-BL
  rect 0.406x1.397 smd: 1(-0.975,-2.3) 2(-0.325,-2.3) 3(0.325,-2.3) 4(0.975,-2.3) 5(0.975,2.3) 6(0.325,2.3) 7(-0.325,2.3) 8(-0.975,2.3)
MSOP-8_L3.0-W3.0-P0.65-LS5.0-BL
  oval 0.364x1.692 smd: 1(-0.975,-2.146) 2(-0.325,-2.146) 3(0.325,-2.146) 4(0.975,-2.146) 5(0.975,2.146) 6(0.325,2.146) 7(-0.325,2.146) 8(-0.975,2.146)
MSOP-10_L3.0-W3.0-P0.50-LS5.0-BL
  oval 0.28x1.62 smd: 1(-1,-2.11) 2(-0.5,-2.11) 3(0,-2.11) 4(0.5,-2.11) 5(1,-2.11) 6(1,2.11) 7(0.5,2.11) 8(0,2.11) 9(-0.5,2.11) 10(-1,2.11)
QFN-28_L5.0-W5.0-P0.50-BL-EP
  oval 0.28x0.9 smd: 1(-1.502,-2.5) 2(-1.001,-2.5) 3(-0.5,-2.5) 4(0,-2.5) 5(0.5,-2.5) 6(1,-2.5) 7(1.501,-2.5) 15(1.501,2.5) 16(1,2.5) 17(0.5,2.5) 18(0,2.5) 19(-0.5,2.5) 20(-1.001,2.5) 21(-1.502,2.5)
  oval 0.9x0.28 smd: 8(2.5,-1.502) 9(2.5,-1.001) 10(2.5,-0.5) 11(2.5,0) 12(2.5,0.5) 13(2.5,1) 14(2.5,1.501) 22(-2.5,1.501) 23(-2.5,1) 24(-2.5,0.5) 25(-2.5,0) 26(-2.5,-0.5) 27(-2.5,-1.001) 28(-2.5,-1.502)
  rect 3.5x3.5 smd: 29(0,0)
QFN-32_L5.0-W5.0-P0.50-BL-EP3.4
  oval 0.28x0.8 smd: 1(-1.75,-2.4) 2(-1.25,-2.4) 3(-0.75,-2.4) 4(-0.25,-2.4) 5(0.25,-2.4) 6(0.75,-2.4) 7(1.25,-2.4) 8(1.75,-2.4) 17(1.75,2.4) 18(1.25,2.4) 19(0.75,2.4) 20(0.25,2.4) 21(-0.25,2.4) 22(-0.75,2.4) 23(-1.25,2.4) 24(-1.75,2.4)
  oval 0.8x0.28 smd: 9(2.4,-1.75) 10(2.4,-1.25) 11(2.4,-0.75) 12(2.4,-0.25) 13(2.4,0.25) 14(2.4,0.75) 15(2.4,1.25) 16(2.4,1.75) 25(-2.4,1.75) 26(-2.4,1.25) 27(-2.4,0.75) 28(-2.4,0.25) 29(-2.4,-0.25) 30(-2.4,-0.75) 31(-2.4,-1.25) 32(-2.4,-1.75)
  rect 3.4x3.4 smd: 33(0,-0.001)
R0402
  rect 0.566x0.54 smd: 1(-0.433,0) 2(0.433,0)
R0603
  rect 0.806x0.864 smd: 1(-0.753,0) 2(0.753,0)
RJ45-TH_DS1129-04
  round 1.6 hole 1: 1(11.354,-3.272) 3(9.314,-3.272) 5(7.361,-3.333) 6(6.34,-1.491) 7(5.322,-3.333) 8(4.303,-1.491) 9(14.739,3.328) 10(12.451,3.33) 11(3.309,3.333) 12(1.021,3.333) 13(-4.394,-3.272) 15(-6.434,-3.272) 17(-8.387,-3.272) 18(-9.408,-1.491) 19(-10.427,-3.272) 20(-11.445,-1.491) 21(-1.008,3.328) 22(-3.297,3.328) 23(-12.438,3.328) 24(-14.727,3.328)
  round 1.397 hole 1: 2(10.335,-1.491) 4(8.296,-1.491) 14(-5.412,-1.491) 16(-7.452,-1.491)
  round 2.3 hole 1.8: 25(15.999,-2.251) 26(-15.999,-2.251)
SIM-SMD_SMN-305
  rect 1.3x1.8 smd: 1(5.85,-6.45) 2(-5.85,-6.45) 3(5.85,2.35) 4(-5.85,2.35)
  rect 0.9x1.2 smd: C1(-3.175,6.45) C2(-0.635,6.45) C3(1.905,6.45) C5(-1.905,6.45) C6(0.635,6.45) C7(3.175,6.45)
SMA-FL_L3.5-W2.5-LS4.6-L-RD
  rect 1.82x1.82 smd: 1(-1.86,0) 2(1.86,0)
SMB_L4.6-W3.6-LS5.3-RD
  rect 2.047x2.192 smd: 1(-2.361,0) 2(2.361,0)
SMD-24_L15.1-W7.1-P1.00-LS10.0-BL
  rect 0.64x2.2 smd: 1(-5.5,-4.7) 2(-4.5,-4.7) 3(-3.5,-4.7) 4(-2.5,-4.7) 5(-1.5,-4.7) 6(-0.5,-4.7) 7(0.5,-4.7) 8(1.5,-4.7) 9(2.5,-4.7) 10(3.5,-4.7) 11(4.5,-4.7) 12(5.5,-4.7) 13(5.5,4.7) 14(4.5,4.7) 15(3.5,4.7) 16(2.5,4.7) 17(1.5,4.7) 18(0.5,4.7) 19(-0.5,4.7) 20(-1.5,4.7) 21(-2.5,4.7) 22(-3.5,4.7) 23(-4.5,4.7) 24(-5.5,4.7)
SOD-523_L1.2-W0.8-LS1.6-RD-2
  rect 0.7x0.5 smd: 1(-0.71,0) 2(0.71,0)
SOM3506_128P
  oval 0.66x1.27 smd: 1(-17.05,-18.835) 2(-15.95,-18.835) 3(-14.85,-18.835) 4(-13.75,-18.835) 5(-12.65,-18.835) 6(-11.55,-18.835) 7(-10.45,-18.835) 8(-9.35,-18.835) 9(-8.25,-18.835) 10(-7.15,-18.835) 11(-6.05,-18.835) 12(-4.95,-18.835) 13(-3.85,-18.835) 14(-2.75,-18.835) 15(-1.65,-18.835) 16(-0.55,-18.835) 17(0.55,-18.835) 18(1.65,-18.835) 19(2.75,-18.835) 20(3.85,-18.835) 21(4.95,-18.835) 22(6.05,-18.835) 23(7.15,-18.835) 24(8.25,-18.835) 25(9.35,-18.835) 26(10.45,-18.835) 27(11.55,-18.835) 28(12.65,-18.835) 29(13.75,-18.835) 30(14.85,-18.835) 31(15.95,-18.835) 32(17.05,-18.835) 65(17.05,18.835) 66(15.95,18.835) 67(14.85,18.835) 68(13.75,18.835) 69(12.65,18.835) 70(11.55,18.835) 71(10.45,18.835) 72(9.35,18.835) 73(8.25,18.835) 74(7.15,18.835) 75(6.05,18.835) 76(4.95,18.835) 77(3.85,18.835) 78(2.75,18.835) 79(1.65,18.835) 80(0.55,18.835) 81(-0.55,18.835) 82(-1.65,18.835) 83(-2.75,18.835) 84(-3.85,18.835) 85(-4.95,18.835) 86(-6.05,18.835) 87(-7.15,18.835) 88(-8.25,18.835) 89(-9.35,18.835) 90(-10.45,18.835) 91(-11.55,18.835) 92(-12.65,18.835) 93(-13.75,18.835) 94(-14.85,18.835) 95(-15.95,18.835) 96(-17.05,18.835)
  oval 1.27x0.66 smd: 33(18.835,-17.05) 34(18.835,-15.95) 35(18.835,-14.85) 36(18.835,-13.75) 37(18.835,-12.65) 38(18.835,-11.55) 39(18.835,-10.45) 40(18.835,-9.35) 41(18.835,-8.25) 42(18.835,-7.15) 43(18.835,-6.05) 44(18.835,-4.95) 45(18.835,-3.85) 46(18.835,-2.75) 47(18.835,-1.65) 48(18.835,-0.55) 49(18.835,0.55) 50(18.835,1.65) 51(18.835,2.75) 52(18.835,3.85) 53(18.835,4.95) 54(18.835,6.05) 55(18.835,7.15) 56(18.835,8.25) 57(18.835,9.35) 58(18.835,10.45) 59(18.835,11.55) 60(18.835,12.65) 61(18.835,13.75) 62(18.835,14.85) 63(18.835,15.95) 64(18.835,17.05) 97(-18.835,17.05) 98(-18.835,15.95) 99(-18.835,14.85) 100(-18.835,13.75) 101(-18.835,12.65) 102(-18.835,11.55) 103(-18.835,10.45) 104(-18.835,9.35) 105(-18.835,8.25) 106(-18.835,7.15) 107(-18.835,6.05) 108(-18.835,4.95) 109(-18.835,3.85) 110(-18.835,2.75) 111(-18.835,1.65) 112(-18.835,0.55) 113(-18.835,-0.55) 114(-18.835,-1.65) 115(-18.835,-2.75) 116(-18.835,-3.85) 117(-18.835,-4.95) 118(-18.835,-6.05) 119(-18.835,-7.15) 120(-18.835,-8.25) 121(-18.835,-9.35) 122(-18.835,-10.45) 123(-18.835,-11.55) 124(-18.835,-12.65) 125(-18.835,-13.75) 126(-18.835,-14.85) 127(-18.835,-15.95) 128(-18.835,-17.05)
SOP-8_L4.9-W3.9-P1.27-LS6.0-BL
  oval 0.63x1.865 smd: 1(-1.905,-2.683) 2(-0.635,-2.683) 3(0.635,-2.683) 4(1.905,-2.683) 5(1.905,2.683) 6(0.635,2.683) 7(-0.635,2.683) 8(-1.905,2.683)
SOT-23-3_L3.0-W1.7-P0.95-LS2.9-BR
  rect 1.038x0.532 smd: 1(1.101,-0.95) 2(1.101,0.95) 3(-1.101,0)
SOT-23-5_L2.9-W1.6-P0.95-LS2.8-BL
  rect 0.6x1 smd: 1(-0.95,-1.1) 2(0,-1.1) 3(0.95,-1.1) 4(0.95,1.1) 5(-0.95,1.1)
SOT-23-5_L3.0-W1.5-P0.95-LS2.8-BL
  rect 0.532x1.045 smd: 1(-0.95,-1.25) 2(0,-1.25) 3(0.95,-1.25) 4(0.95,1.25) 5(-0.95,1.25)
SOT-23-6_L2.9-W1.6-P0.95-LS2.8-BL
  rect 0.532x1.072 smd: 1(-0.95,-1.149) 2(0,-1.149) 3(0.95,-1.149) 4(0.95,1.149) 5(0,1.149) 6(-0.95,1.149)
SOT-523-3_L1.6-W0.8-P1.00-LS1.6-BR
  rect 0.51x0.4 smd: 1(0.65,-0.5) 2(0.65,0.5) 3(-0.65,0)
SW-SMD_L3.9-W3.0-P4.45
  rect 1.23x1.86 smd: 1(-2.185,0) 2(2.185,0)
Test-Point-0.5mm
  round 0.5 smd: 1(0,0)
TF-SMD_TF-PUSH
  rect 0.7x1.6 smd: 1(2.25,5.3) 2(1.15,5.3) 3(0.05,5.3) 4(-1.05,5.3) 5(-2.15,5.3) 6(-3.25,5.3) 7(-4.35,5.3) 8(-5.45,5.3) CD(-6.55,5.3)
  rect 1.2x1.5 smd: 10(-7.75,4.3)
  rect 1.2x2.2 smd: 11(-7.75,-5.3) 12(7.75,-5.3)
  rect 1.6x1.5 smd: 13(6.85,4.3)
TSSOP-16_L5.0-W4.4-P0.65-LS6.4-BL
  oval 0.343x1.732 smd: 1(-2.275,-2.866) 2(-1.625,-2.866) 3(-0.975,-2.866) 4(-0.325,-2.866) 5(0.325,-2.866) 6(0.975,-2.866) 7(1.625,-2.866) 8(2.275,-2.866) 9(2.275,2.866) 10(1.625,2.866) 11(0.975,2.866) 12(0.325,2.866) 13(-0.325,2.866) 14(-0.975,2.866) 15(-1.625,2.866) 16(-2.275,2.866)
USB-A-TH_AF-SS-JB17.6
  rect 1.6x1.6 hole 1: 1(-3.5,2.45) 5(-3.5,-0.15)
  round 1.397 hole 1: 2(-1,2.45) 6(-1,-0.15)
  round 1.6 hole 1: 3(1,2.45) 4(3.5,2.45) 7(1,-0.15) 8(3.5,-0.15)
  round 3 hole 2.3: 9(-6.55,2.85) 10(6.55,2.85) 11(-6.55,-2.85) 12(6.55,-2.85)
USB-C-SMD_TYPE-C-16PIN-2MD-073
  oval 1.1x1.9 hole 0.6x1.3: 13(-4.325,1.825) 14(4.325,1.825)
  oval 1.2x1.6 hole 0.6x1: 13(-4.325,-2.375) 14(4.325,-2.375)
  rect 0.55x1.1 smd: A1B12(-3.2,2.375) A4B9(-2.4,2.375) B1A12(3.2,2.375) B4A9(2.4,2.375)
  rect 0.3x1.1 smd: A5(-1.25,2.375) A6(-0.25,2.375) A7(0.25,2.375) A8(1.25,2.375) B5(1.75,2.375) B6(0.75,2.375) B7(-0.75,2.375) B8(-1.75,2.375)
WIRELM-SMD_M573H-USBDG-NN
  rect 1.6x3 smd: 1(4.66,6) 2(2.66,6) 3(-4.66,-6) 4(-1.86,-6) 5(1.64,-6) 6(4.14,-6)

## Nets
As in the schematic, except:
GND: BT1.1 C1.1 C2.1 C3.1 C4.1 C5.2 C8.1 C9.1 C10.1 C11.1 C12.1 C13.1 C15.1 C16.1 C17.1 C18.1 C19.1 C20.1 C21.1 C22.1 C23.1 C24.1 C25.1 C26.1 C27.2 C28.2 C29.2 C30.2 C31.1 C32.1 C33.2 C34.1 C35.1 C36.2 C37.2 C38.2 C39.2 C40.1 C41.1 C42.2 C43.1 C45.1 C46.1 C48.1 C51.2 C53.1 C54.1 C55.1 C56.1 C57.1 C58.1 C59.1 C60.1 C61.1 C62.1 C63.1 C64.1 C65.1 C66.1 C67.1 C68.2 C69.1 C70.1 C71.2 C72.1 C73.1 C74.2 C75.1 C76.1 C77.1 C79.1 C80.1 C82.1 C83.1 C84.2 C85.2 C86.2 C87.1 C88.2 C92.2 C94.2 C96.2 C97.1 C99.2 C100.2 C101.2 C102.1 C103.1 C104.2 C105.1 C106.2 C107.1 C108.1 C109.1 C110.1 C111.1 C112.1 C113.1 C115.1 C116.1 C117.1 C118.1 C119.1 C120.1 C121.1 C122.1 C123.1 C124.1 C125.1 C126.1 C127.1 C128.1 C129.1 C130.1 C131.1 C133.1 C134.1 CARD1.6 CARD1.10 CARD1.11 CARD1.12 CARD1.13 CARD2.1 CARD2.2 CARD2.3 CARD2.4 CARD2.C5 CN1.2 CN2.4 CN3.4 CN4.2 CN5.2 CN6.2 CN7.3 CN7.4 D1.2 D2.3 D3.3 D4.3 D6.3 D7.3 D9.3 DC2.2 DC2.3 FPC1.4 FPC1.6 FPC1.8 FPC1.10 FPC1.13 FPC1.16 FPC1.19 FPC1.20 FPC1.21 FPC1.22 FPC1.23 FPC1.24 FPC1.30 FPC1.31 FPC1.32 LED1.2 Q1.2 Q2.2 Q3.2 Q4.2 Q5.2 R2.1 R5.1 R6.1 R7.1 R11.1 R20.1 R22.2 R24.2 R29.1 R36.1 R38.2 R40.2 R45.1 R53.1 R59.1 R71.2 R81.2 R87.1 R89.1 R90.1 R100.2 R104.2 R106.1 R111.1 R114.1 R125.1 R128.1 R135.1 R138.2 R139.1 R140.2 R142.2 RF1.2 RF1.3 SW1.2 SW2.2 SW3.2 U1.2 U2.9 U3.2 U4.33 U5.3 U5.8 U6.3 U6.8 U7.33 U8.15 U9.2 U9.5 U10.5 U11.2 U11.5 U12.5 U13.3 U13.8 U14.3 U14.8 U15.3 U15.8 U16.2 U17.3 U17.8 U18.3 U18.8 U20.3 U20.8 U21.3 U21.8 U22.2 U23.29 U24.2 U25.3 U25.8 U26.3 U26.8 U27.3 U27.8 U28.12 U28.19 U28.30 U28.37 U29.3 U29.8 U30.3 U30.8 U31.3 U31.8 U32.3 U32.8 U33.3 U33.8 U34.3 U35.3 U35.8 U36.3 U36.4 U37.3 U37.8 U38.7 U39.4 U40.1 U40.6 U41.2 U42.2 U43.1 U43.10 U43.27 U43.34 U43.36 U43.37 U43.40 U43.41 U43.45 U43.46 U43.47 U43.48 U43.70 U43.71 U43.72 U43.73 U43.88 U43.89 U43.90 U43.91 U43.92 U43.93 U43.94 U43.95 U44.3 U44.8 USB1.13 USB1.14 USB1.A1B12 USB1.B1A12 USB2.13 USB2.14 USB2.A1B12 USB2.B1A12 USB3.4 USB3.8 X1.2 X1.4 X2.2 X2.4 X3.2 X3.4

Pads without a net: CARD2 C6; CN1 1; CN4 1; CN5 1; CN6 1; DC2 4 5; M1 5 10 12 15 17 23 32 35 44 48 61 67 75 82 87 90 97 100 105 110 115 124; R75 1; R85 1; RJ1 4 5 7 8 16 17 19 20; SCREW1 1; SCREW2 1; SCREW3 1; SCREW4 1; U2 4; U4 11 13 18 27 28; U7 11 13 18 27 28; U15 4 5 6 7; U17 6 7 9; U18 5 6 7 9; U19 3 4 5 6 10; U20 4 5 6 7; U23 5 8 9 18 23 26; U25 1 2 4 5; U34 1 2 8 9 10; U37 4 5 6 7 9 10; U39 3 7; U40 2; U43 2 3 4 5 6 8 9 16 17 18 19 20 21 22 23 24 26 28 29 30 31 32 33 44 49 50 51 52 53 54 55 56 57 58 61 62 63 64 65 66 67 68 69 74 75 76 77 78 79 80 81 82 83 84 85 86 87 96 97 98 99 100 101 102 103 104 105 106 107 108 109; U44 5 6; USB1 A8 B8; USB2 A8 B8

## Via types
v1: diameter 0.45, hole 0.3, Top Layer to Bottom Layer, 49 vias

## Routing (per net, layer and track width the routed paths; a pad name or vN(x,y) marks a point on that pad's centre or on a via; arc(x,y) is an arc through that point)
AVDD33_PHY0: length 12.7
  Top Layer w0.28: R21.1 21.61,52.56 22.12,53.06 v1(22.88,53.06) U4.7 ; v1(25.64,57.66) 25.64,56.76 U4.30
  Bottom Layer w0.28: v1(22.88,53.06) 22.88,57.17 23.37,57.66 v1(25.64,57.66)
AVDD33_PHY1: length 12.6
  Top Layer w0.152: U7.7 42.28,65.54 v1(40.89,65.54) 40.89,62.82 ; U7.30 v1(43.95,70.36)
  Bottom Layer w0.152: v1(43.95,70.36) 41.91,70.36 40.89,69.35 v1(40.89,65.54)
DVDD33: length 52.8
  Top Layer w0.28: R27.2 v1(33.78,54.08) ; 50.33,66.55 v1(54.1,66.55) v1(54.1,60.2) ; R26.2 33.73,56.09 v1(33.78,56.14) ; v1(22.86,48.01) 22.86,49.56 R23.1 ; 50.33,68.39 v1(54.1,68.39) ; v1(41.91,60.2) R39.1
  Bottom Layer w0.28: v1(54.1,66.55) v1(54.1,68.39) ; v1(54.1,60.2) v1(41.91,60.2) ; v1(33.78,56.14) v1(33.78,54.08) 33.78,48.52 33.27,48.01 27.65,48.01 27.65,48.02 23.41,48.02 23.4,48.01 v1(22.86,48.01)
DVDD33_PHY0: length 11.5
  Top Layer w0.152: U4.14 27.09,50.97 27.43,50.62 v1(27.43,47.5) ; R30.1 v1(23.62,47.5)
  Bottom Layer w0.152: v1(23.62,47.5) v1(27.43,47.5)
VCC3V3: length 33.2
  Top Layer w0.152: C17.2 17.27,32.89 17.27,32.26 17.78,31.75 TP4_3V3.1 19.65,32.35 19.65,40.94 19.78,41.07 19.78,41.47 19.65,41.6 C32.2 ; 13.72,32.46 13.72,32.77 13.35,33.13 10.78,33.13 10.67,33.02 10.67,31.75 10.16,31.25 8.38,31.25 7.76,31.86 R9.2
  Top Layer w0.508: L2.2 15.24,34.79 15.24,33.4 14.3,32.46 13.61,32.46
VCC5V: length 1.6
  Top Layer w0.152: TP2_5V.1 17.32,51.68 C2.2
VCC5V_SYS: length 25.7
  Top Layer w0.152: 12.69,46.82 13.19,47.32 13.19,48.01 12.21,48.98 U1.5 ; TP3_SYS5V.1 18.17,41.27 17.48,41.96 L1.2
  Top Layer w0.508: L1.2 14.72,45.69 14.72,46.82 ; 1.44,40.6 1.67,40.36 1.67,38.46 2.03,38.1 9.67,38.1 U3.4
VCC12V: length 6
  Top Layer w0.152: 7.49,47.36 7.47,47.34 7.47,46.34 7.37,46.23 4.08,46.23 R3.2
ETH_RMII0_CLK: length 26.5
  Top Layer w0.152: M1.74 28.66,40.68 27.97,41.38 R33.2
ETH_RMII0_MDC: length 26
  Top Layer w0.152: 28.43,55.12 45.21,55.12 46.74,53.6 46.74,51.57 47.5,50.8 49.81,50.8 49.92,50.91 49.92,52.37
ETH_RMII0_MDIO: length 23.2
  Top Layer w0.152: 48.82,52.37 48.77,52.42 48.77,54.87 48.04,55.59 28.46,55.59 28.42,55.63
ETH_RMII0_RSTN: length 4.3
  Top Layer w0.152: U4.21 31.11,54.56 R27.1 31.6,52.82 C33.1
ETH_RMII0_RXD0: length 29.5
  Top Layer w0.152: R25.2 24.16,41.91 ; M1.73 45.8,41.91 v1(28.7,41.91)
  Bottom Layer w0.152: v1(24.13,41.91) v1(28.7,41.91)
ETH_RMII0_RXD1: length 27.2
  Top Layer w0.152: v1(28.96,42.93) 45.89,42.93 M1.72 ; R28.2 v1(25.42,42.93)
  Bottom Layer w0.152: v1(25.42,42.93) v1(28.96,42.93)
ETH_RMII0_RXDVCRS: length 27.1
  Top Layer w0.152: U4.26 27.59,56.99 27.94,57.34 28.22,57.34 29,58.12 31.5,58.12 31.85,58.48 31.85,58.49 31.98,58.62 47.3,58.62 47.75,58.17 v1(47.75,56.65) ; v1(47.75,54.61) 47.72,54.58 47.72,52.37
  Bottom Layer w0.152: v1(47.75,56.65) v1(47.75,54.61)
ETH_RMII0_TXD0: length 21.7
  Top Layer w0.152: R34.2 29.21,49.62 29.21,45.22 30.44,43.98 M1.71
ETH_RMII0_TXD1: length 17.3
  Top Layer w0.152: R35.2 32.46,45.27 32.65,45.08 M1.70
ETH_RMII0_TXEN: length 18.2
  Top Layer w0.152: R32.2 42.44,51.54 42.93,51.06 42.93,46.74 43.43,46.23 45.89,46.23 M1.69
ETH_RMII1_CLK: length 27
  Top Layer w0.152: v1(49.28,60.77) 46.17,60.77 45.97,60.96 R49.2 ; v1(60.45,57.92) v1(64.26,57.92) ; 64.22,52.37 64.26,52.41 v1(64.26,53.34)
  Bottom Layer w0.152: v1(64.26,57.92) v1(64.26,53.34) ; v1(49.28,60.77) 59.13,60.77 60.3,59.59 60.3,58.07 v1(60.45,57.92)
ETH_RMII1_MDC: length 32.5
  Top Layer w0.152: 66.42,52.37 66.42,54.56 64.59,56.39 56.39,56.39 55.37,57.41 55.37,66.91 54.72,67.56 U7.22
ETH_RMII1_MDIO: length 35.6
  Top Layer w0.152: v1(67.56,58.68) 58.93,58.68 58.17,59.44 v1(58.17,67.82) ; U7.23 48.79,68.06 49.02,67.82 v1(56.39,67.82) ; 67.52,52.37 67.56,52.41 v1(67.56,54.36)
  Bottom Layer w0.152: v1(56.39,67.82) v1(58.17,67.82) ; v1(67.56,58.68) v1(67.56,54.36)
ETH_RMII1_RSTN: length 3.6
  Top Layer w0.152: U7.21 48.96,67.06 R43.1 49.41,66.49 C42.1
ETH_RMII1_RXD0: length 24.5
  Top Layer w0.152: 58.72,52.37 58.72,53.3 v1(58.67,53.34) ; R41.2 42.93,61.95 42.93,59.44 43.29,59.08 v1(48.26,59.08)
  Bottom Layer w0.152: v1(48.26,59.08) 57.51,59.08 58.67,57.92 v1(58.67,53.34)
ETH_RMII1_RXD1: length 24.8
  Top Layer w0.152: v1(49.02,59.69) 44.2,59.69 43.94,59.95 R44.2 ; 59.82,52.37 59.82,53.21 v1(59.69,53.34)
  Bottom Layer w0.152: v1(59.69,53.34) 59.69,58.93 58.94,59.69 v1(49.02,59.69)
ETH_RMII1_RXDVCRS: length 42.1
  Top Layer w0.152: U7.26 45.95,70.09 46.23,70.36 49.41,70.36 R38.1 49.53,70.48 49.53,71.38 49.64,71.49 56.03,71.49 57.15,70.36 57.15,57.31 57.3,57.15 67.06,57.15 68.62,55.59 68.62,52.37
ETH_RMII1_TXD0: length 22.5
  Top Layer w0.152: 60.92,52.37 60.96,52.41 v1(60.96,53.34) ; v1(49.78,61.22) 47.24,61.22 46.99,61.47 R50.2
  Bottom Layer w0.152: v1(49.78,61.22) 59.44,61.22 60.96,59.69 v1(60.96,53.34)
ETH_RMII1_TXD1: length 21.1
  Top Layer w0.152: 50.33,62.49 50.33,55.08 51.31,54.11 61.72,54.11 62.02,53.81 62.02,52.37
ETH_RMII1_TXEN: length 23.3
  Top Layer w0.152: 63.12,52.37 63.12,53.98 62.48,54.61 52.58,54.61 51.56,55.63 51.56,63.29 50.33,64.52
HUB_DM3: length 5.9
  Top Layer w0.152: 68.6,72.54 68.6,73.65 68.21,74.04 66.02,74.04 65.19,74.87 65.19,75.75
HUB_DM4: length 7.1
  Top Layer w0.152: 66.59,71.6 66.6,71.61 66.6,72.66 66.34,72.93 65.26,72.93 63.61,74.58 62.62,74.58 62.38,74.81 62.38,75.69 ; 66.59,71.54 66.65,71.54
HUB_DP3: length 6.8
  Top Layer w0.152: 63.72,75.83 63.67,75.78 63.67,75.2 63.94,74.93 64.39,74.93 65.67,73.65 68.04,73.65 68.12,73.57 68.12,72.53
HUB_DP4: length 8.3
  Top Layer w0.152: 60.95,75.73 60.95,74.51 61.28,74.19 62.74,74.19 65.83,71.1 66.65,71.1
LAN0_A+: length 15.6
  Top Layer w0.152: RJ1.1 15.93,88.47 15.93,83.14 20.07,79 22.86,79 23.37,78.49 23.37,77.93 23.44,77.86
LAN0_A-: length 14
  Top Layer w0.152: 24.44,77.86 24.44,78.94 23.88,79.51 20.57,79.51 17.1,82.98 RJ1.2
LAN0_B+: length 17.2
  Top Layer w0.152: 26.44,77.86 26.44,79.48 25.91,80.01 20.83,80.01 18.12,82.72 RJ1.3
LAN0_B-: length 14.6
  Top Layer w0.152: 27.44,77.86 27.43,77.86 27.43,80.01 26.92,80.52 21.84,80.52 21.09,81.27 RJ1.6
LAN0_LED0: length 2.8
  Top Layer w0.152: 31.5,56.09 31.47,56.06 U4.24
LAN0_LED1: length 3.6
  Top Layer w0.152: U4.25 28.52,57.14 R24.1
LAN0_RXN: length 29
  Top Layer w0.152: v1(27.43,63.76) 27.43,64.33 U5.5 U5.6 27.44,65.23 L3.6 ; v1(18.03,63.5) 18.03,54.11 18.58,53.56 U4.6
  Bottom Layer w0.152: v1(27.43,63.76) 27.18,63.5 v1(18.03,63.5)
LAN0_RXP: length 27.6
  Top Layer w0.152: U5.4 U5.7 26.92,65.21 v1(26.92,65.79) 26.44,66.27 L3.5 ; v1(18.54,64.27) 18.54,55.12 19.6,54.06 U4.5
  Bottom Layer w0.152: v1(18.54,64.27) 24.64,64.27 26.16,65.79 v1(26.92,65.79)
LAN0_TXN: length 25.4
  Top Layer w0.152: L3.3 24.46,67.68 v1(24.46,66.3) 24.71,66.04 25.66,66.04 25.92,65.79 U5.9 U5.2 ; U4.4 19.86,54.56 19.3,55.12 v1(19.3,65.79)
  Bottom Layer w0.152: v1(24.46,66.3) 19.81,66.3 v1(19.3,65.79)
LAN0_TXP: length 22.1
  Top Layer w0.152: U4.3 20.38,55.06 20.07,55.38 20.07,64.74 20.49,65.17 25.38,65.17 U5.10 U5.1 ; 23.44,65.35 L3.2
LAN1_A+: length 13.1
  Top Layer w0.152: L3.17 29.44,79.48 29.97,80.01 30.99,80.01 31.83,80.85 31.83,86.4 31.82,86.41 31.82,87.27 31.83,87.27 RJ1.13
LAN1_A-: length 11.2
  Top Layer w0.152: RJ1.14 32.84,80.85 31.5,79.51 30.73,79.51 30.44,79.21 L3.16
LAN1_B+: length 12.1
  Top Layer w0.152: L3.14 32.44,79.18 33.87,80.61 RJ1.15
LAN1_B-: length 12.3
  Top Layer w0.152: L3.13 33.44,79.16 34.29,80.01 36.32,80.01 36.84,80.53 RJ1.18
LAN1_LED0: length 2.4
  Top Layer w0.152: R42.1 49.3,68.56 U7.24
LAN1_LED1: length 3.1
  Top Layer w0.152: R40.1 46.65,69.4 U7.25
LAN1_RXN: length 13.3
  Top Layer w0.152: U7.6 36.06,66.06 34.42,67.69 L3.12 33.44,65.7 32.94,65.21 U6.6 U6.5
LAN1_RXP: length 17
  Top Layer w0.152: U7.5 36.32,66.56 34.8,68.08 34.8,68.84 33.93,69.71 32.62,69.71 32.51,69.6 32.51,67.77 L3.11 32.44,65.97 32.26,65.79 32.26,64.35 U6.4
LAN1_TXN: length 20.5
  Top Layer w0.152: U6.2 U6.9 31.25,65.78 31.1,65.94 30.59,65.94 30.48,66.04 30.48,67.65 L3.9 30.23,67.91 30.23,69.85 30.59,70.22 34.69,70.22 35.31,69.6 35.31,68.33 36.58,67.06 U7.4
LAN1_TXP: length 22.7
  Top Layer w0.152: U6.1 U6.10 30.67,65.28 29.72,65.28 29.44,65.56 L3.8 29.46,67.72 29.46,70.62 29.72,70.87 35.56,70.87 35.81,70.62 35.81,68.84 37.1,67.56 U7.3
$3N1819: length 5.7
  Top Layer w0.152: R6.2 R3.1 3.7,48.16 4.32,48.77 6.1,48.77 6.2,48.66 6.2,47.38 U2.3
$3N1991: length 10.6
  Top Layer w0.152: R5.2 0.93,43.23 1.61,42.55 6.07,42.55 6.22,42.4 U2.6
$3N2283: length 8.3
  Top Layer w0.152: C6.2 10.58,47.66 10.16,47.25 10.16,46.59 10.05,46.49 9.4,46.49 9.14,46.23 9.14,41.93 U2.8
$3N2287: length 3.2
  Top Layer w0.152: U2.1 9.33,47.36 v1(9.44,47.25) ; 11.67,46.82 11.59,46.74 v1(10.72,46.74)
  Bottom Layer w0.152: v1(9.44,47.25) 9.95,46.74 v1(10.72,46.74)
$3N4434: length 1.1
  Top Layer w0.152: R1.1 11.97,53.52 U1.4
$3N4821: length 1.1
  Top Layer w0.152: U1.3 14.96,53.52 R2.2
$3N6109: length 1.6
  Top Layer w0.152: LED1.1 12.74,31.19 R10.1
$5N364: length 2.7
  Top Layer w0.152: C26.2 22.12,56.53 22.12,55.86 22.42,55.56 U4.2
$5N400: length 1.7
  Top Layer w0.152: R29.2 26.09,51.06 U4.12
$5N408: length 2.4
  Top Layer w0.152: U4.16 28.09,51.8 28.98,51.8 29.2,51.57 R34.1
$5N412: length 5.1
  Top Layer w0.152: C25.2 23.94,59.76 X1.3 24.59,59.82 U4.32
$5N414: length 5.7
  Top Layer w0.152: U4.31 25.09,57.86 25.4,58.17 25.4,60.71 X1.1
$5N442: length 6
  Top Layer w0.152: R35.1 31.01,49 30.5,49.51 30.5,52.3 30.25,52.56 U4.17
$5N651: length 4.9
  Top Layer w0.152: U4.20 30.78,54.06 31.01,53.83 31.01,52.12 R32.1
$5N1462: length 1.6
  Top Layer w0.152: U4.15 27.59,50.83 R33.1
$5N2204: length 3.3
  Top Layer w0.152: R20.2 22.63,57.31 22.63,56.23 22.8,56.06 U4.1
$5N2881: length 3
  Top Layer w0.152: U4.8 23.93,52.56 23.14,52.56 22.89,52.3 R23.2
$5N2924: length 5.5
  Top Layer w0.152: U4.19 30.52,53.56 30.76,53.32 30.76,51.11 R31.1
$5N3506: length 2.7
  Top Layer w0.152: U4.29 26.09,58.1 26.42,58.42 27.27,58.42 C28.1
$5N4420: length 12.7
  Top Layer w0.152: v1(22.5,64.72) 22.5,63.36 22.61,63.25 27.69,63.25 28.45,62.49 29.46,62.49 29.97,61.98 C43.2 ; v1(22.5,65.83) 22.5,67.64 L3.1
  Bottom Layer w0.152: v1(22.5,64.72) v1(22.5,65.83)
$5N4728: length 11.2
  Top Layer w0.152: v1(25.4,66.55) 25.44,66.59 L3.4 ; C45.2 31.27,62.46 30.99,62.74 28.7,62.74 28.19,63.25 v1(28.19,66.04)
  Bottom Layer w0.152: v1(25.4,66.55) 25.65,66.3 27.93,66.3 v1(28.19,66.04)
$5N4743: length 9.9
  Top Layer w0.152: C46.2 32.77,61.89 32.77,63.11 32.51,63.36 29.21,63.36 28.96,63.61 28.96,66.44 28.53,66.86 28.53,67.61 L3.7
$5N4758: length 8.1
  Top Layer w0.152: v1(31.5,66.3) 31.44,66.35 L3.10 ; C48.2 v1(33.78,65.03)
  Bottom Layer w0.152: v1(31.5,66.3) 33.27,66.3 33.78,65.79 v1(33.78,65.03)
$5N4975: length 7.8
  Top Layer w0.152: R54.1 15.87,77.09 L3.24
$5N4989: length 12.5
  Top Layer w0.152: R55.1 24.47,74.51 25.4,75.44 25.4,77.05 L3.21
$5N5185: length 16.9
  Top Layer w0.152: L3.18 28.45,77.09 28.45,75.95 27.94,75.44 26.16,75.44 21.08,70.36 R56.1
$5N5200: length 21
  Top Layer w0.152: R57.1 20.37,68.64 26.67,74.93 30.99,74.93 31.35,75.3 31.35,77 L3.15
$5N5218: length 3.9
  Top Layer w0.152: C44.1 13.47,72.57 R54.2
$5N5594: length 3.9
  Top Layer w0.152: R56.2 13.47,66.73 C47.1
$5N9162: length 4.7
  Top Layer w0.152: U7.17 47.72,65.06 47.94,64.84 47.94,62.64 48.09,62.49 R51.1
$5N9163: length 4.1
  Top Layer w0.152: R48.1 49.02,64.52 48.77,64.77 48.77,66.3 48.51,66.56 U7.20
$5N9164: length 4.6
  Top Layer w0.152: U7.19 48.04,66.06 48.26,65.84 48.26,63.76 48.51,63.5 R47.1
$5N9166: length 1.6
  Top Layer w0.152: U7.15 45.97,64.39 45.97,62.82
$5N9168: length 1.8
  Top Layer w0.152: U7.16 46.99,63.87 46.99,62.82
$5N9169: length 2.4
  Top Layer w0.152: U7.8 41.91,64.66 41.91,62.82
$5N9174: length 8
  Top Layer w0.152: U7.31 43.45,70.89 44.45,71.89 44.45,73.41 X2.1 46.99,74.51 C36.1
$5N9233: length 2.6
  Top Layer w0.152: U7.29 44.45,70.87 44.7,71.12 C37.1
$5N9236: length 5.1
  Top Layer w0.152: 43.27,72.74 X2.3 ; 43.27,72.74 42.95,72.42 U7.32 ; 43.27,72.74 C34.2
$5N9254: length 2.7
  Top Layer w0.152: C35.2 40.39,68.06 U7.2
$5N9255: length 2.9
  Top Layer w0.152: U7.1 41.26,69.6 R36.2
$5N11286: length 14.1
  Top Layer w0.152: R52.2 16.51,77.73 v1(17.53,78.74)
  Bottom Layer w0.152: v1(17.53,78.74) 17.53,81.28 19.3,83.06 25.36,83.06 RJ1.12
  vias: v1(44.45,84.33)
$5N11391: length 5
  Top Layer w0.152: RJ1.9 14.22,80.49 R53.2
$5N11729: length 3.6
  Top Layer w0.152: RJ1.24 45.77,82.02 45.8,82.05
$5N23946: length 1.6
  Top Layer w0.152: 42.92,62.82 42.95,62.85 U7.9
$5N23989: length 1.8
  Top Layer w0.152: U7.10 43.45,63.31 43.94,62.82
$5N24066: length 1.6
  Top Layer w0.152: R28.1 25.09,50.78 U4.10
$5N24072: length 1.6
  Top Layer w0.152: U4.9 24.16,51.48 R25.1
$5N24085: length 1.8
  Top Layer w0.152: U7.12 44.45,63.33 44.96,62.82
$8N422: length 5.8
  Top Layer w0.203: U23.10 69.59,74.43 69.7,74.53 69.96,74.53 70.36,74.93 70.36,76.46 71.21,77.31 X3.3
$8N430: length 3.1
  Top Layer w0.203: X3.1 69.09,75.44 U23.11
$8N2590: length 7.7
  Top Layer w0.152: 58.09,81.16 58.09,78.39 58.16,78.32 61.8,78.32 62.32,77.79 62.32,77.34
$8N2595: length 8.3
  Top Layer w0.152: 61.03,77.37 57.26,77.37 55.75,78.87 55.75,81.31
$8N3622: length 12.8
  Top Layer w0.152: 63.69,77.22 62.04,78.86 59.05,78.86 58.94,78.97 58.94,81.91 58.28,82.57 56.03,82.57 55.76,82.85 55.76,83.7
$8N3681: length 12.2
  Top Layer w0.152: 65.06,77.14 65.06,78.44 64.57,78.94 62.74,78.94 61.72,79.96 61.72,82.42 61.51,82.63 59.04,82.63 57.85,83.83

## Copper pours and planes (outline as drawn; the poured copper is in the pictures)
DVDD33 on Top Layer: 20.3,49.85 23.38,49.85 23.38,49.07 20.3,49.07
DVDD33 on Top Layer: 39.59,62.34 42.41,62.34 42.41,61.44 39.59,61.44
DVDD33 on Top Layer: 39.59,64.05 40.24,64.05 40.24,61.38 39.59,61.38
DVDD33 on Top Layer: 20.31,51.05 20.96,51.05 20.96,48.15 20.31,48.15
VCC3V3 on Top Layer: 16.9,35.35 17.78,35.35 17.78,32.42 16.9,32.42
VCC3V3 on Top Layer: 38.5,61.06 39.12,61.06 39.12,59.19 38.5,59.19
VCC3V3 on Top Layer: 19.12,47.77 19.84,47.77 19.84,46.07 19.12,46.07
VCC3V3 on Top Layer: 6.41,35.92 8.46,35.92 8.46,35.13 6.41,35.13
VCC3V3 on Top Layer: 14.48,35.31 17.78,35.31 17.78,33.47 14.48,33.47
VCC3V3 on Top Layer: 14.48,35.82 16.49,35.82 16.49,33.42 14.48,33.42
VCC5V on Top Layer: 14.22,51.82 17.64,51.82 17.64,50.77 14.22,50.77
VCC5V on Top Layer: 15.39,50.77 16.23,50.77 16.23,47.31 15.39,47.31
VCC5V_SYS on Top Layer: 9.14,51.82 12.7,51.82 12.7,50.55 9.14,50.55
VCC5V_SYS on Top Layer: 12.35,47.24 15.11,47.24 15.11,46.23 12.35,46.23
VCC5V_SYS on Top Layer: 10.67,37.6 17.78,37.6 17.78,36.07 10.67,36.07
VCC5V_SYS on Top Layer: 16.95,41.91 17.78,41.91 17.78,35.73 16.95,35.73
VCC5V_SYS on Top Layer: 0.94,40.92 2.79,40.92 2.79,39.88 0.94,39.88
VCC12V on Top Layer: 5.59,60.2 12.45,60.2 12.45,54.87 5.59,54.87
VCC12V on Top Layer: 5.59,67.31 7.87,67.31 7.87,54.87 5.59,54.87
VCC12V on Top Layer: 7.12,55.52 7.87,55.52 7.87,46.74 7.12,46.74
VCC12V on Top Layer: 1.78,67.31 7.37,67.31 7.37,64.77 1.78,64.77
VCC12V on Top Layer: 5.36,57.29 8.89,57.29 8.89,54.87 5.36,54.87
$3N170 on Top Layer: 9.31,70.36 11.44,70.36 11.44,63.5 9.31,63.5
$3N170 on Top Layer: 8.13,70.36 11.43,70.36 11.43,68.33 8.13,68.33
$3N1909 on Top Layer: 7.18,42.18 7.87,42.18 7.87,39.63 7.18,39.63
$3N2188 on Top Layer: 0.76,42.17 5.25,42.17 5.25,41.15 0.76,41.15
$3N2287 on Top Layer: 11,47.24 12.19,47.24 12.19,43.44 11,43.44
$3N5404 on Top Layer: 5.08,37.34 9.63,37.34 9.63,36.14 5.08,36.14
$3N5408 on Top Layer: 10.81,35.14 13.72,35.14 13.72,33.7 10.81,33.7
$3N5841 on Top Layer: 8.64,35.11 9.65,35.11 9.65,33.02 8.64,33.02

## Text on the board
Top Silkscreen Layer: PHY0
